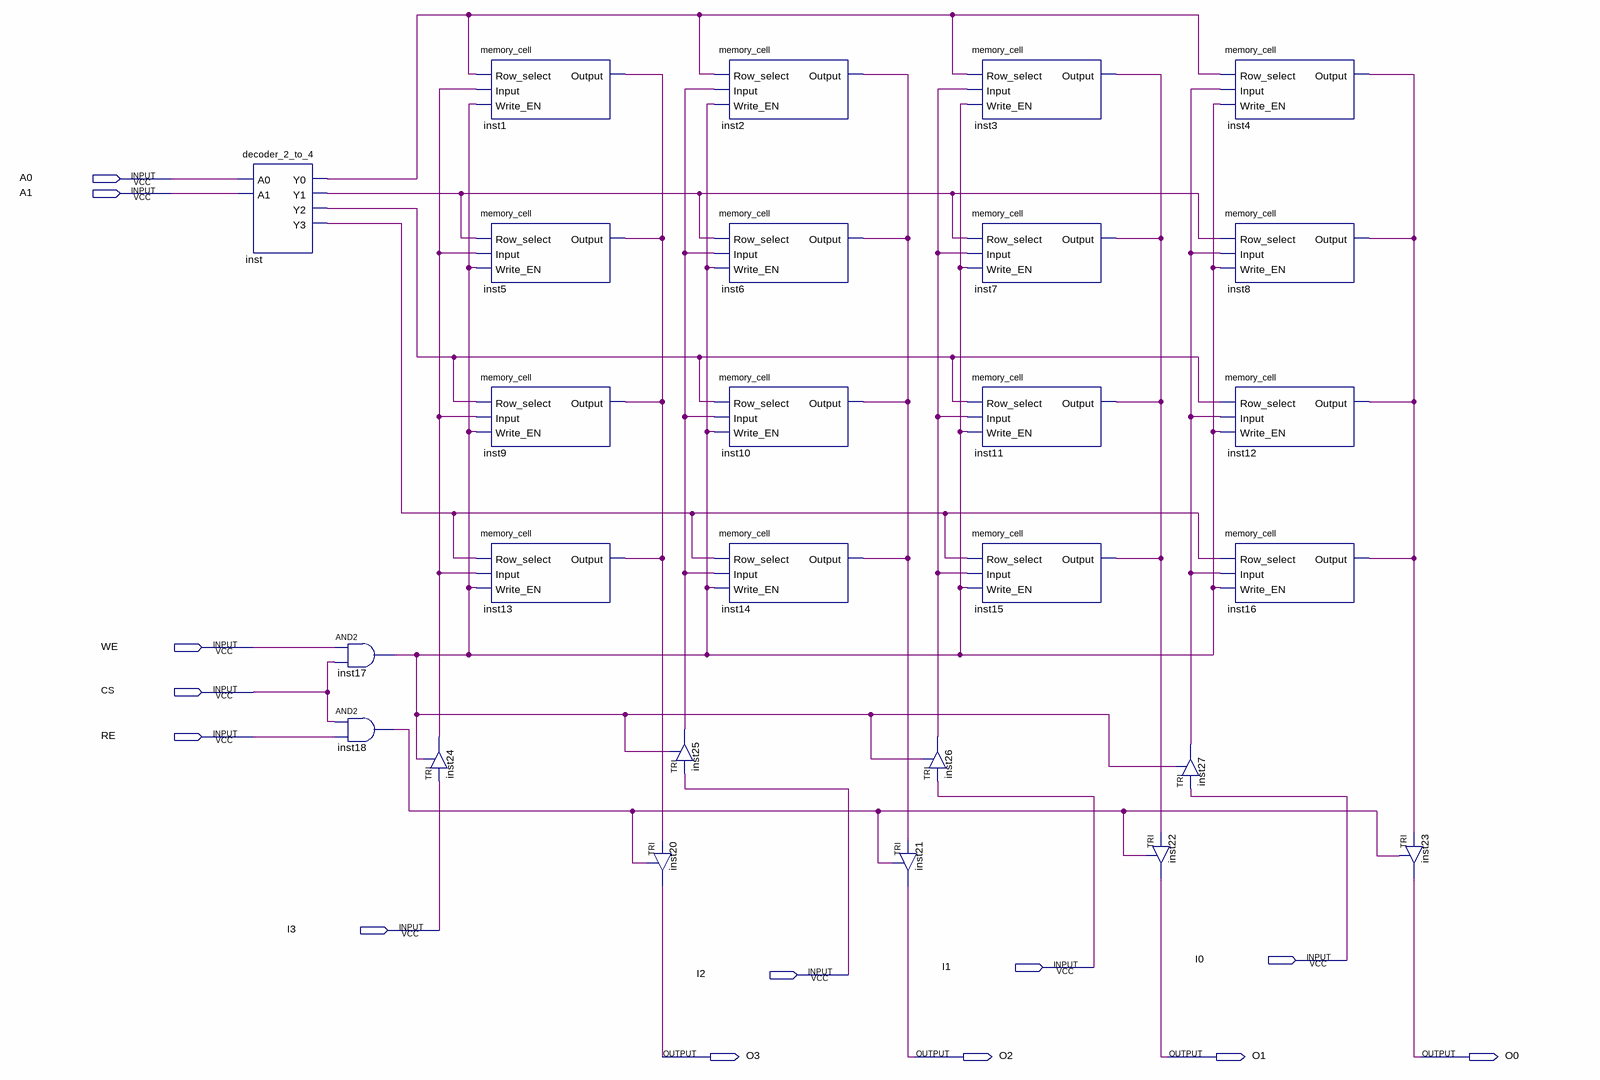
[diagram p0: schematic sheet]
// Quartus schematic ram_4x4.bdf as structural Verilog: 27 symbols, 13 pins
module ram_4x4 (
  input  A0,
  input  A1,
  input  WE,
  input  CS,
  input  RE,
  input  I3,
  input  I0,
  input  I1,
  input  I2,
  output O3,
  output O2,
  output O1,
  output O0
);

  wire inst1_output, inst2_output, inst3_output, inst4_output, inst17_out, inst18_out, inst24_out,
       inst25_out, inst26_out, inst27_out, inst_y0, inst_y1, inst_y2, inst_y3;

  decoder_2_to_4 inst (.A0(A0), .A1(A1), .Y0(inst_y0), .Y1(inst_y1), .Y2(inst_y2), .Y3(inst_y3));
  and inst17 (inst17_out, WE, CS);
  and inst18 (inst18_out, CS, RE);
  TRI inst24 (.IN(I3), .OE(inst17_out), .OUT(inst24_out));
  memory_cell inst1 (.Row_select(inst_y0), .Input(inst24_out), .Write_EN(inst17_out), .Output(inst1_output));
  memory_cell inst5 (.Row_select(inst_y1), .Input(inst24_out), .Write_EN(inst17_out), .Output(inst1_output));
  memory_cell inst9 (.Row_select(inst_y2), .Input(inst24_out), .Write_EN(inst17_out), .Output(inst1_output));
  memory_cell inst13 (.Row_select(inst_y3), .Input(inst24_out), .Write_EN(inst17_out), .Output(inst1_output));
  TRI inst25 (.IN(I2), .OE(inst17_out), .OUT(inst25_out));
  TRI inst20 (.IN(inst1_output), .OE(inst18_out), .OUT(O3));
  memory_cell inst2 (.Row_select(inst_y0), .Input(inst25_out), .Write_EN(inst17_out), .Output(inst2_output));
  memory_cell inst6 (.Row_select(inst_y1), .Input(inst25_out), .Write_EN(inst17_out), .Output(inst2_output));
  memory_cell inst10 (.Row_select(inst_y2), .Input(inst25_out), .Write_EN(inst17_out), .Output(inst2_output));
  memory_cell inst14 (.Row_select(inst_y3), .Input(inst25_out), .Write_EN(inst17_out), .Output(inst2_output));
  TRI inst26 (.IN(I1), .OE(inst17_out), .OUT(inst26_out));
  TRI inst21 (.IN(inst2_output), .OE(inst18_out), .OUT(O2));
  memory_cell inst3 (.Row_select(inst_y0), .Input(inst26_out), .Write_EN(inst17_out), .Output(inst3_output));
  memory_cell inst7 (.Row_select(inst_y1), .Input(inst26_out), .Write_EN(inst17_out), .Output(inst3_output));
  memory_cell inst11 (.Row_select(inst_y2), .Input(inst26_out), .Write_EN(inst17_out), .Output(inst3_output));
  memory_cell inst15 (.Row_select(inst_y3), .Input(inst26_out), .Write_EN(inst17_out), .Output(inst3_output));
  TRI inst22 (.IN(inst3_output), .OE(inst18_out), .OUT(O1));
  memory_cell inst4 (.Row_select(inst_y0), .Input(inst27_out), .Write_EN(inst17_out), .Output(inst4_output));
  memory_cell inst8 (.Row_select(inst_y1), .Input(inst27_out), .Write_EN(inst17_out), .Output(inst4_output));
  memory_cell inst12 (.Row_select(inst_y2), .Input(inst27_out), .Write_EN(inst17_out), .Output(inst4_output));
  memory_cell inst16 (.Row_select(inst_y3), .Input(inst27_out), .Write_EN(inst17_out), .Output(inst4_output));
  TRI inst27 (.IN(I0), .OE(inst17_out), .OUT(inst27_out));
  TRI inst23 (.IN(inst4_output), .OE(inst18_out), .OUT(O0));
endmodule
